# Altium schematic sheet Controller Section.SchDoc
size A4
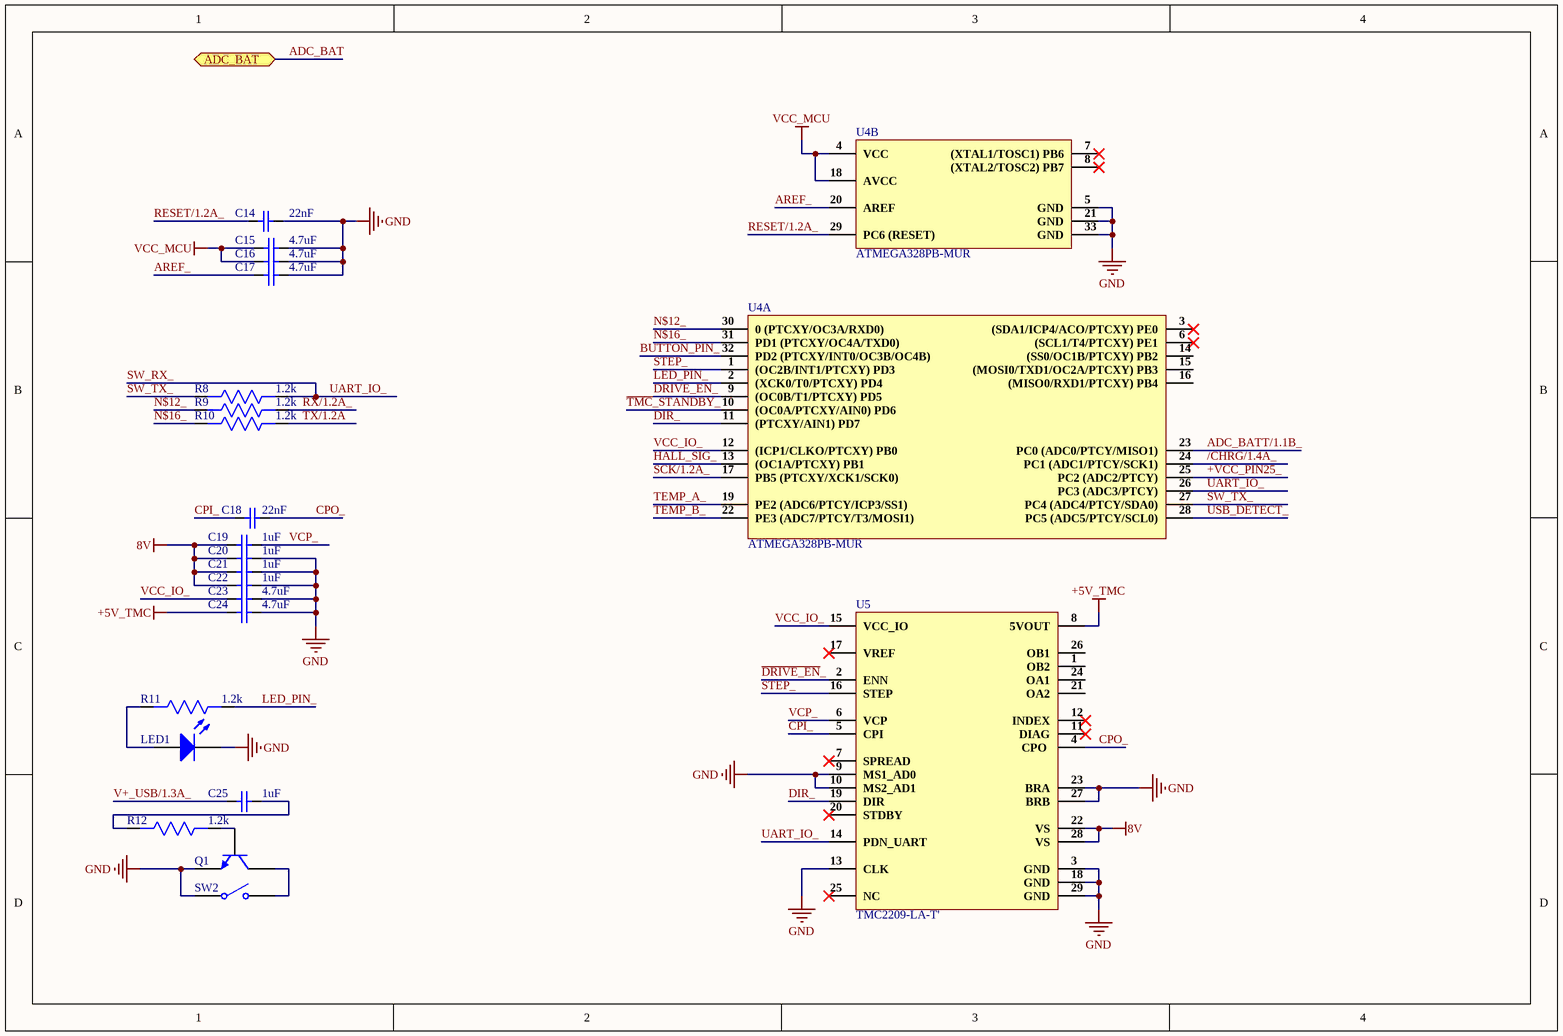
[diagram p0: Controller Section.SchDoc]

## Parts
C14  22nF  [CAP 0201]
C15  4.7uF  [Cap0402]
C16  4.7uF  [Cap0402]
C17  4.7uF  [Cap0402]
C18  22nF  [CAP 0201]
C19  1uF  [Cap0402]
C20  1uF  [Cap0402]
C21  1uF  [Cap0402]
C22  1uF  [Cap0402]
C23  4.7uF  [Cap0402]
C24  4.7uF  [Cap0402]
C25  1uF  [Cap0402]
LED1  IN-S63AT5UW  [LED 0603]  (value not drawn)
Q1  2SC1623-L6-TP  [SOT-23]  (value not drawn)
R8  1.2k  [Res-0201]
R9  1.2k  [Res-0201]
R10  1.2k  [Res-0201]
R11  1.2k  [Res-0201]
R12  1.2k  [Res-0201]
SW2  434121025816  [434121025816]  (value not drawn)
U4  ATMEGA328PB-MUR  [32-VQFN]  (parts A,B of 2)
U5  TMC2209-LA-T'  [QFN-28]

## Ports
ADC_BAT (bidir)

## Nets
8V: C19.2 C20.2 C21.2 C22.2 U5.22(VS) U5.28(VS)
+5V_TMC: C24.2 U5.8(5VOUT)
GND: C14.1 C15.1 C16.1 C17.1 C20.1 C21.1 C22.1 C23.1 C24.1 LED1.1(K) Q1.2(E) SW2.1 U4.5(GND) U4.21(GND) U4.33(GND) U5.3(GND) U5.9(MS1_AD0) U5.10(MS2_AD1) U5.13(CLK) U5.18(GND) U5.23(BRA) U5.27(BRB) U5.29(GND)
VCC_MCU: C15.2 C16.2 U4.4(VCC) U4.18(AVCC)
+VCC_PIN25_: U4.25(PC2_(ADC2/PTCY))
/CHRG/1.4A_: U4.24(PC1_(ADC1/PTCY/SCK1))
~{DRI}~{VE_EN}_: U4.9((OC0B/T1/PTCXY)_PD5) U5.2(ENN)
~{TM}~{C_ST}~{AND}~{BY}_: U4.10((OC0A/PTCXY/AIN0)_PD6)
ADC_BAT: port ADC_BAT
ADC_BATT/1.1B_: U4.23(PC0_(ADC0/PTCY/MISO1))
AREF_: C17.2 U4.20(AREF)
BUTTON_PIN_: U4.32(PD2_(PTCXY/INT0/OC3B/OC4B))
CPI_: C18.2 U5.5(CPI)
CPO_: C18.1 U5.4(CPO)
DIR_: U4.11((PTCXY/AIN1)_PD7) U5.19(DIR)
HALL_SIG_: U4.13((OC1A/PTCXY)_PB1)
LED_PIN_: R11.1 U4.2((XCK0/T0/PTCXY)_PD4)
N$12_: R9.2 U4.30(0_(PTCXY/OC3A/RXD0))
N$16_: R10.2 U4.31(PD1_(PTCXY/OC4A/TXD0))
RESET/1.2A_: C14.2 U4.29(PC6_(RESET))
RX/1.2A_: R9.1
SCK/1.2A_: U4.17(PB5_(PTCXY/XCK1/SCK0))
STEP_: U4.1((OC2B/INT1/PTCXY)_PD3) U5.16(STEP)
SW_RX_: R8.1 U4.26(PC3_(ADC3/PTCY)) U5.14(PDN_UART)  [also labelled UART_IO_]
SW_TX_: R8.2 U4.27(PC4_(ADC4/PTCY/SDA0))
TEMP_A_: U4.19(PE2_(ADC6/PTCY/ICP3/SS1))
TEMP_B_: U4.22(PE3_(ADC7/PTCY/T3/MOSI1))
TX/1.2A: R10.1
USB_DETECT_: U4.28(PC5_(ADC5/PTCY/SCL0))
V+_USB/1.3A_: C25.2
VCC_IO_: C23.2 U4.12((ICP1/CLKO/PTCXY)_PB0) U5.15(VCC_IO)
VCP_: C19.1 U5.6(VCP)
NetC25_1: C25.1 R12.2
NetLED1_2: LED1.2(A) R11.2
NetQ1_1: Q1.1(B) R12.1
NetQ1_3: Q1.3(C) SW2.2

Not connected (* = marked no-connect by the designer): U4 3((SDA1/ICP4/ACO/PTCXY)_PE0)* 6((SCL1/T4/PTCXY)_PE1)* 7((XTAL1/TOSC1)_PB6)* 8((XTAL2/TOSC2)_PB7)* 14((SS0/OC1B/PTCXY)_PB2) 15((MOSI0/TXD1/OC2A/PTCXY)_PB3) 16((MISO0/RXD1/PTCXY)_PB4); U5 1(OB2) 7(SPREAD)* 11(DIAG)* 12(INDEX)* 17(VREF)* 20(STDBY)* 21(OA2) 24(OA1) 25(NC)* 26(OB1)

## Library data of the parts
C14 C18 = TMK063BJ223KP-F: CAP CER 0.022UF 25V X5R 0201; Manufacturer: Taiyo Yuden; Tolerance: 10%; Supplier 1: Digi-Key; Manufacturer Part Number: TMK063BJ223KP-F; RoHS: No; Category: Ceramic Capacitors; Stock 1: 108943; Pricing 1: 1=0.10000, 10=0.02100, 50=0.01120, 100=0.00920, 500=0.00654, 1000=0.00514, 2500=0.00468, 5000=0.00430 (USD); Mount: Surface Mount; Case/Package: 0201; Case Code (Imperial): 0201; Case Code (Metric): 0603; Min Operating Temperature: -55°C; Max Operating Temperature: 85°C; Packaging: Tape and Reel; Capacitance: 22nF; Voltage Rating: 25V; ComponentLink1URL: https://ds.yuden.co.jp/TYCOMPAS/ut/detail?pn=TMK063BJ223KP-F &amp;u=M&src-supplier=Digi-Key; ComponentLink1Description: https://ds.yuden.co.jp/TYCOMPAS/ut/detail?pn=TMK063BJ223KP-F &amp;u=M&src-supplier=Digi-Key; ComponentLink2URL: http://ds.yuden.co.jp/TYCOMPAS/ut/detail.do?productNo=TMK063BJ223KP-F&amp;fileName=TMK063BJ223KP-F_SS&amp;mode=specSheetDownload&src-supplier=Digi-Key; ComponentLink2Description: http://ds.yuden.co.jp/TYCOMPAS/ut/detail.do?productNo=TMK063BJ223KP-F&amp;fileName=TMK063BJ223KP-F_SS&amp;mode=specSheetDownload&src-supplier=Digi-Key; Supplier Part Number 1: 587-6154-1-ND
C15-C17 C23 C24 = GRM155R61A475MEAAD: CAP CER 4.7UF 10V X5R 0402; Manufacturer: Murata; Tolerance: 20%; Supplier 1: Arrow Electronics; Manufacturer Part Number: GRM155R61A475MEAAD; Category: Ceramic Capacitors; Stock 1: 5; Pricing 1: 1=0.15280, 100000=0.02590, 1000000=0.02570, 10000000=0.02490 (USD); Mount: Surface Mount; Case/Package: 0402; Case Code (Imperial): 0402; Case Code (Metric): 1005; Min Operating Temperature: -55°C; Max Operating Temperature: 85°C; Packaging: Tape and Reel; Capacitance: 4.7uF; Voltage Rating: 10V; ComponentLink1URL: http://www.farnell.com/datasheets/2189109.pdf?src-supplier=Farnell; ComponentLink1Description: http://www.farnell.com/datasheets/2189109.pdf?src-supplier=Farnell; ComponentLink2URL: https://search.murata.co.jp/Ceramy/image/img/A01X/G101/ENG/GRM155R61A475MEAA-01.pdf?src-supplier=Digi-Key; ComponentLink2Description: https://search.murata.co.jp/Ceramy/image/img/A01X/G101/ENG/GRM155R61A475MEAA-01.pdf?src-supplier=Digi-Key; ComponentLink3URL: http://www.farnell.com/datasheets/2189109.pdf?src-supplier=Newark; ComponentLink3Description: http://www.farnell.com/datasheets/2189109.pdf?src-supplier=Newark; ComponentLink4URL: http://www.farnell.com/datasheets/2189109.pdf?src-supplier=Element14; ComponentLink4Description: http://www.farnell.com/datasheets/2189109.pdf?src-supplier=Element14; ComponentLink5URL: http://datasheet.octopart.com/GRM155R61A475MEAAD-Murata-datasheet-138740730.pdf?src-supplier=Ciiva+Crawler; ComponentLink5Description: http://datasheet.octopart.com/GRM155R61A475MEAAD-Murata-datasheet-138740730.pdf?src-supplier=Ciiva+Crawler; ComponentLink6URL: http://datasheet.octopart.com/GRM155R61A475MEAAD-Murata-datasheet-140690084.pdf?src-supplier=Ciiva+Crawler; ComponentLink6Description: http://datasheet.octopart.com/GRM155R61A475MEAAD-Murata-datasheet-140690084.pdf?src-supplier=Ciiva+Crawler; ComponentLink7URL: http://datasheet.octopart.com/GRM155R61A475MEAAD-Murata-datasheet-141266224.pdf?src-supplier=Ciiva+Crawler; ComponentLink7Description: http://datasheet.octopart.com/GRM155R61A475MEAAD-Murata-datasheet-141266224.pdf?src-supplier=Ciiva+Crawler; ComponentLink8URL: http://datasheet.octopart.com/GRM155R61A475MEAAD-Murata-datasheet-68589269.pdf?src-supplier=Newark; ComponentLink8Description: http://datasheet.octopart.com/GRM155R61A475MEAAD-Murata-datasheet-68589269.pdf?src-supplier=Newark; ComponentLink9URL: http://datasheet.octopart.com/GRM155R61A475MEAAD-Murata-datasheet-8819587.pdf; ComponentLink9Description: http://datasheet.octopart.com/GRM155R61A475MEAAD-Murata-datasheet-8819587.pdf; ComponentLink10URL: http://datasheet.octopart.com/GRM155R61A475MEAAD-Murata-datasheet-10025737.pdf; ComponentLink10Description: http://datasheet.octopart.com/GRM155R61A475MEAAD-Murata-datasheet-10025737.pdf; ComponentLink11URL: http://datasheet.octopart.com/GRM155R61A475MEAAD-Murata-datasheet-11978611.pdf; ComponentLink11Description: http://datasheet.octopart.com/GRM155R61A475MEAAD-Murata-datasheet-11978611.pdf; ComponentLink12URL: http://datasheet.octopart.com/GRM155R61A475MEAAD-Murata-datasheet-12510076.pdf; ComponentLink12Description: http://datasheet.octopart.com/GRM155R61A475MEAAD-Murata-datasheet-12510076.pdf; ComponentLink13URL: http://datasheet.octopart.com/GRM155R61A475MEAAD-Murata-datasheet-12515295.pdf; ComponentLink13Description: http://datasheet.octopart.com/GRM155R61A475MEAAD-Murata-datasheet-12515295.pdf; Supplier Part Number 1: GRM155R61A475MEAAD
C19-C22 C25 = CC0402KRX5R6BB105: Multilayer Ceramic Capacitors MLCC - SMD/SMT 1uF 10V X5R 10%
LED1 = IN-S63AT5UW: Led White Clear 0603 SMD; Manufacturer: Inolux; Lens Style: Flat; Luminous Intensity: 900mcd; Forward Voltage: 3V; Test Current: 5mA; Viewing Angle: 120°; Lens Size: 0.8mm; Supplier 1: Digi-Key; Manufacturer Part Number: IN-S63AT5UW; RoHS: No; Category: LEDs; Stock 1: 275915; Pricing 1: 1=0.33000, 10=0.17700, 100=0.08210, 500=0.07576, 1000=0.05934, 2000=0.05808 (USD); Mount: Surface Mount; Case/Package: 0603; Color: White; Lens Color: Clear; Case Code (Imperial): 0603; Case Code (Metric): 1608; Packaging: Tape and Reel; Lens Transparency: Clear; Length: 1.6mm; Width: 0.8mm; Height: 0.4mm; ComponentLink1URL: http://www.inolux-corp.com/datasheet/SMDLED/Mono%20Color%20Top%20View/IN-S63AT%20Series_V1.1.pdf?src-supplier=Digi-Key; ComponentLink1Description: http://www.inolux-corp.com/datasheet/SMDLED/Mono%20Color%20Top%20View/IN-S63AT%20Series_V1.1.pdf?src-supplier=Digi-Key; Supplier Part Number 1: 1830-1063-1-ND
Q1 = 2SC1623-L6-TP: TRANS PREBIAS NPN 50V SOT23; Manufacturer: MCC; Max Collector Current: 100mA; Collector Emitter Voltage (VCEO): 300mV; Max Power Dissipation: 200mW; Transition Frequency: 250MHz; Supplier 1: Digi-Key; Manufacturer Part Number: 2SC1623-L6-TP; RoHS: No; Stock 1: 3000; Pricing 1: 3000=0.04740 (USD); Mount: Surface Mount; Case/Package: TO-236-3; Min Operating Temperature: -55°C; Max Operating Temperature: 150°C; Packaging: Tape and Reel; Collector Emitter Breakdown Voltage: 50V; ComponentLink1URL: http://www.mouser.com/ds/2/258/2SC1623(SOT-23)-276330.pdf?src-supplier=Mouser; ComponentLink1Description: http://www.mouser.com/ds/2/258/2SC1623(SOT-23)-276330.pdf?src-supplier=Mouser; ComponentLink2URL: http://www.mccsemi.com/up_pdf/2SC1623(SOT-23).pdf?src-supplier=Digi-Key; ComponentLink2Description: http://www.mccsemi.com/up_pdf/2SC1623(SOT-23).pdf?src-supplier=Digi-Key; Supplier Part Number 1: 2SC1623-L6-TP-ND
R8-R12 = RC0201JR-071K2L: RES SMD 1.2K OHM 5% 1/20W 0201; Manufacturer: Yageo; Temperature Coefficient: 200ppm/°C; Resistance: 1.2kR; Max Power Dissipation: 50mW; Supplier 1: Digi-Key; Manufacturer Part Number: RC0201JR-071K2L; RoHS: Yes; Category: Chip SMD Resistors; Stock 1: 285; Pricing 1: 1=0.10000, 10=0.02600, 100=0.01040, 1000=0.00466, 2500=0.00405, 5000=0.00334 (USD); Case/Package: 0201; Contact Plating: Tin,Matte; Case Code (Imperial): 0201; Case Code (Metric): 0603; Min Operating Temperature: -55°C; Max Operating Temperature: 125°C; Resistor Type: Thick Film; Tolerance: 5%; Number of Terminations: 2; Package Quantity: 1; Packaging: Tape and Reel; Features: Moisture Resistant; Length: 0.024inch; Width: 0.012inch; Height: 0.01inch; Radiation Hardening: No; ComponentLink1URL: https://datasheet.ciiva.com/8895/pyu-rc0201-51-rohs-l-8-8895816.pdf?src-supplier=Avnet; ComponentLink1Description: https://datasheet.ciiva.com/8895/pyu-rc0201-51-rohs-l-8-8895816.pdf?src-supplier=Avnet; ComponentLink2URL: https://datasheet.ciiva.com/16855/pyu-rc0201-51-rohs-l-8-16855241.pdf?src-supplier=Avnet+Europe; ComponentLink2Description: https://datasheet.ciiva.com/16855/pyu-rc0201-51-rohs-l-8-16855241.pdf?src-supplier=Avnet+Europe; ComponentLink3URL: https://datasheet.ciiva.com/2462/pyu-r-int-thick-7-2462826.pdf?src-supplier=Digi-Key; ComponentLink3Description: https://datasheet.ciiva.com/2462/pyu-r-int-thick-7-2462826.pdf?src-supplier=Digi-Key; ComponentLink4URL: https://datasheet.ciiva.com/2462/pyu-r-int-thick-7-2462827.pdf?src-supplier=Digi-Key; ComponentLink4Description: https://datasheet.ciiva.com/2462/pyu-r-int-thick-7-2462827.pdf?src-supplier=Digi-Key; ComponentLink5URL: https://datasheet.ciiva.com/28418/pyu-rc0201-51-rohs-l-8-28418507.pdf?src-supplier=Avnet+Europe; ComponentLink5Description: https://datasheet.ciiva.com/28418/pyu-rc0201-51-rohs-l-8-28418507.pdf?src-supplier=Avnet+Europe; ComponentLink6URL: https://datasheet.ciiva.com/2462/pyu-r-int-thick-7-2462828.pdf?src-supplier=Digi-Key; ComponentLink6Description: https://datasheet.ciiva.com/2462/pyu-r-int-thick-7-2462828.pdf?src-supplier=Digi-Key; Supplier Part Number 1: 311-1.2KNCT-ND
SW2 = 434121025816: SWITCH TACTILE SPST-NO 0.05A 12V; Manufacturer: Wurth Electronics; Mechanical Life: 50000Cycles; Actuator Material: Polymer,Liquid Crystal Polymer; Contact Current Rating: 50mA; Operating Force: 160gf; Illumination Type: Non-Illuminated,Illuminated; Throw Configuration: SPST; Insulation Resistance: 100MR; Switch Travel: 0.25mm; Switch Function: Off-Mom; Actuator Type: Standard; Actuator Length: 0.8mm; Supplier 1: Digi-Key; Manufacturer Part Number: 434121025816; RoHS: Yes; Category: Tactile Switches; Stock 1: 2355; Pricing 1: 1=0.55000, 50=0.50700, 100=0.46100, 500=0.41900, 1000=0.36400 (USD); Mount: Surface Mount; Contact Material: Stainless Steel,Steel; Min Operating Temperature: -40°C; Max Operating Temperature: 85°C; Current Rating: 50mA; Packaging: Tape and Reel; Termination: SMD/SMT; Length: 7.3mm; Width: 3.9mm; Height: 2.5mm; REACH SVHC: No SVHC; Lead Free: Lead Free; ComponentLink1URL: https://datasheet.ciiva.com/30466/0900766b8126b630-30466740.pdf?src-supplier=RSComponents; ComponentLink1Description: https://datasheet.ciiva.com/30466/0900766b8126b630-30466740.pdf?src-supplier=RSComponents; ComponentLink2URL: https://datasheet.ciiva.com/29123/711753-da-01-en-taster-434121025816-29123820.pdf?src-supplier=Conrad; ComponentLink2Description: https://datasheet.ciiva.com/29123/711753-da-01-en-taster-434121025816-29123820.pdf?src-supplier=Conrad; ComponentLink3URL: https://datasheet.ciiva.com/1532/434121025816-1532523.pdf?src-supplier=Element14; ComponentLink3Description: https://datasheet.ciiva.com/1532/434121025816-1532523.pdf?src-supplier=Element14; ComponentLink4URL: https://datasheet.ciiva.com/1633/434121025816-1633932.pdf?src-supplier=Farnell; ComponentLink4Description: https://datasheet.ciiva.com/1633/434121025816-1633932.pdf?src-supplier=Farnell; Supplier Part Number 1: 732-7045-1-ND
U4 = ATMEGA328PB-MUR: IC MCU 8BIT 32KB FLASH 32VFQFN
U5 = TMC2209-LA-T: Motor Driver, Stepper, QFN-28; Manufacturer: Trinamic; Supplier 1: Digi-Key; Manufacturer Part Number: TMC2209-LA-T; RoHS: No; Stock 1: 1949; Pricing 1: 1=2.74000, 50=2.46000, 100=2.17000, 500=1.88000, 1000=1.59001 (USD); Supplier Part Number 1: 1460-1398-1-ND